# Altium project Karta Radiowa.PrjPcb (part 9 of 9)

## Sheet Flash.SchDoc
size A3
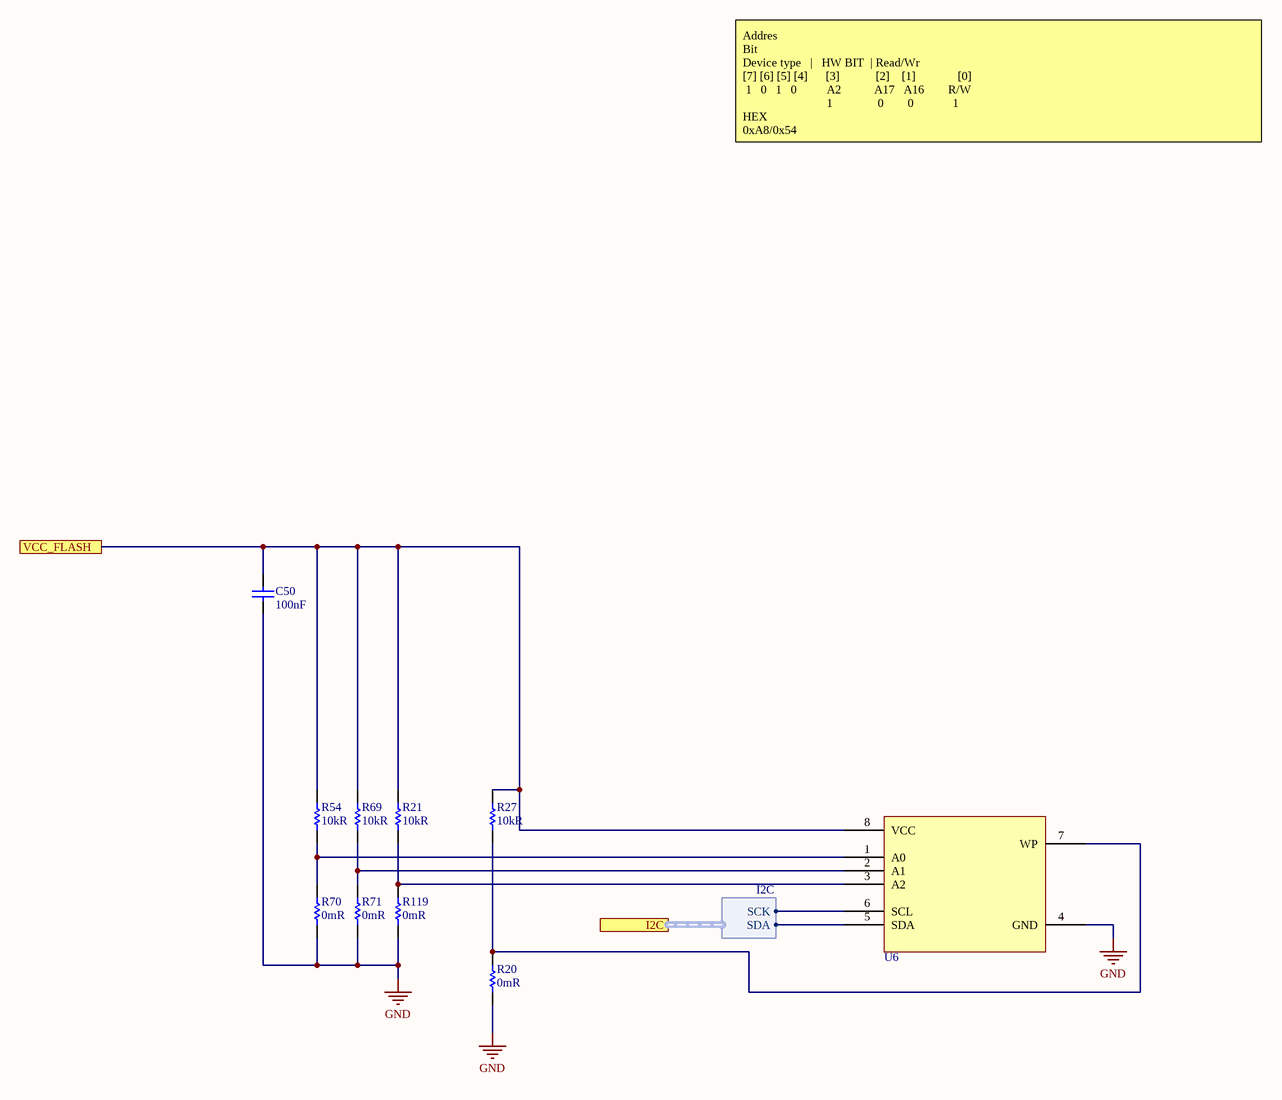
[diagram p14: Flash.SchDoc]

### Parts
C50  100nF  [CAP 0201/0603 KK]
R20  0mR  [RES 0402/1005 RF KK]
R21  10kR  [RES 0402/1005 RF KK]
R27  10kR  [RES 0402/1005 RF KK]
R54  10kR  [RES 0402/1005 RF KK]
R69  10kR  [RES 0402/1005 RF KK]
R70  0mR  [RES 0402/1005 RF KK]
R71  0mR  [RES 0402/1005 RF KK]
R119  0mR  [RES 0402/1005 RF KK]
U6  24LC32AT-I/SN  [8-SOIC 3.9]  (value not drawn)

### Ports
I2C (harness I2C), VCC_FLASH

### Harnesses
I2C: SCK, SDA

### Nets
3V3_MB: C50.2 R21.2 R27.2 R54.2 R69.2 U6.8(VCC) ; port VCC_FLASH
GND: C50.1 R20.1 R70.1 R71.1 R119.1 U6.4(GND)
I2C_SCL: U6.6(SCL) ; port I2C.SCK
I2C_SDA: U6.5(SDA) ; port I2C.SDA
NetR20_2: R20.2 R27.1 U6.7(WP)
NetR21_1: R21.1 R119.2 U6.3(A2)
NetR54_1: R54.1 R70.2 U6.1(A0)
NetR69_1: R69.1 R71.2 U6.2(A1)

### Notes on the sheet
- Addres
  Bit
  Device type   |   HW BIT		| Read/Wr
  [7] [6] [5] [4]      [3]            [2]    [1]              [0]
  1   0   1   0          A2           A17   A16        R/W
  1               0        0             1
  HEX
  0xA8/0x54
- Title
- Size:
- Date:
- A3
- Number:
- Time:
- Revision:
- Sheet
- of
- File:

### Library data of the parts
C50 = Capacitor: Manufacturer 1: Murata; Manufacturer Part Number 1: GRM033R61C104ME84D; Voltage Rating: 16V; Tolerance: 20%; Dielectric: X5R; Supplier 1: Digi-Key; Supplier Part Number 1: 490-9986-1-ND; Stock 1: 503570; Pricing 1: 1=0.10000, 10=0.05400, 100=0.02430, 500=0.01732, 1000=0.01361, 2500=0.01238, 5000=0.01139 (USD); RoHS: Yes; Mount: Surface Mount; Case/Package: 0201; Weight: 1.2E-05oz; Case Code (Metric): 0603; Case Code (Imperial): 0201; Min Operating Temperature: -55°C; Max Operating Temperature: 85°C; Capacitance: 100nF; Packaging: Tape and Reel; Termination: SMD/SMT; Voltage Rating (DC): 16V; Package Quantity: 15000; Length: 0.024inch; Height: 0.3mm; Width: 0.3mm; Thickness: 0.013inch; ComponentLink1URL: http://www.mouser.com/ds/2/281/c02e-2905.pdf?src-supplier=Mouser; ComponentLink1Description: http://www.mouser.com/ds/2/281/c02e-2905.pdf?src-supplier=Mouser; ComponentLink2URL: http://search.murata.co.jp/Ceramy/image/img/A01X/G101/ENG/GRM033R61C104ME84-01.pdf?src-supplier=Digi-Key; ComponentLink2Description: http://search.murata.co.jp/Ceramy/image/img/A01X/G101/ENG/GRM033R61C104ME84-01.pdf?src-supplier=Digi-Key
R20 = Resistor: YAGEO - RC0402JR-070RL. - RES, THICK FILM, 0R, 0.0625W, 0402; Power Rating: 62.5mW; Tolerance: 5%; Voltage Rating: 50V; Max Power Dissipation: 63mW; Temperature Coefficient: 200ppm/°C; Supplier 1: Digi-Key; Supplier Part Number 1: 311-0.0JRCT-ND; Manufacturer: Yageo; Manufacturer Part Number: RC0402JR-070RL; RoHS: Yes; Category: Chip SMD Resistors; Stock 1: 45338179; Pricing 1: 1=0,10000, 10=0,01200, 25=0,00920, 50=0,00680, 100=0,00510, 250=0,00388, 500=0,00310, 1000=0,00228, 5000=0,00163 (USD); Case/Package: 0402; Case Code (Metric): 1005; Case Code (Imperial): 0402; Contact Plating: Tin,Matte; Min Operating Temperature: -55°C; Max Operating Temperature: 155°C; Package Quantity: 1; Resistance: 0mR; Packaging: Tape and Reel; Resistor Type: Thick Film; Number of Terminations: 2; Termination: SMD/SMT; Features: Moisture Resistant; Length: 1mm; Height: 0.016inch; Width: 0.02inch; Depth: 0.5mm; Radiation Hardening: No; REACH SVHC: Unknown; Military Standard: Not; Lead Free: Lead Free; ComponentLink1URL: https://datasheet.ciiva.com/2452/pyu-rc0402-51-rohs-l-6-2452608.pdf?src-supplier=Digi-Key; ComponentLink1Description: https://datasheet.ciiva.com/2452/pyu-rc0402-51-rohs-l-6-2452608.pdf?src-supplier=Digi-Key; ComponentLink2URL: https://datasheet.ciiva.com/11808/0900766b80c66297-11808195.pdf?src-supplier=RSComponents; ComponentLink2Description: https://datasheet.ciiva.com/11808/0900766b80c66297-11808195.pdf?src-supplier=RSComponents; ComponentLink3URL: https://datasheet.ciiva.com/2452/pyu-r-int-thick-7-2452609.pdf?src-supplier=Digi-Key; ComponentLink3Description: https://datasheet.ciiva.com/2452/pyu-r-int-thick-7-2452609.pdf?src-supplier=Digi-Key; ComponentLink4URL: https://datasheet.ciiva.com/2452/pyu-r-int-thick-7-2452610.pdf?src-supplier=Digi-Key; ComponentLink4Description: https://datasheet.ciiva.com/2452/pyu-r-int-thick-7-2452610.pdf?src-supplier=Digi-Key; ComponentLink5URL: https://datasheet.ciiva.com/8896/pyu-rc0402-51-rohs-l-6-8896201.pdf?src-supplier=Avnet; ComponentLink5Description: https://datasheet.ciiva.com/8896/pyu-rc0402-51-rohs-l-6-8896201.pdf?src-supplier=Avnet; ComponentLink6URL: https://datasheet.ciiva.com/28386/pyu-rc0402-51-rohs-l-6-28386633.pdf?src-supplier=Avnet+Europe; ComponentLink6Description: https://datasheet.ciiva.com/28386/pyu-rc0402-51-rohs-l-6-28386633.pdf?src-supplier=Avnet+Europe; ComponentLink7URL: https://datasheet.ciiva.com/22747/1018594-22747515.pdf?src-supplier=Element14; ComponentLink7Description: https://datasheet.ciiva.com/22747/1018594-22747515.pdf?src-supplier=Element14; ComponentLink8URL: https://datasheet.ciiva.com/15189/getdatasheetpartid-326379-15189533.pdf?src-supplier=Verical; ComponentLink8Description: https://datasheet.ciiva.com/15189/getdatasheetpartid-326379-15189533.pdf?src-supplier=Verical
R21 R27 R54 R69 = Resistor: Manufacturer 1: Vishay; Manufacturer Part Number 1: CRCW0402-10K0FKED; Tolerance: 1%; Power Rating: 63mW; Voltage Rating: 50V; Temperature Coefficient: 100ppm/°C; Supplier 1: Newark; Supplier Part Number 1: 52K6595; Stock 1: 0; RoHS: Yes; Mount: Surface Mount; Case/Package: 0402; Number of Pins: 2; Weight: 2.3E-05oz; Case Code (Metric): 1005; Case Code (Imperial): 0402; Contact Plating: Tin; Min Operating Temperature: -55°C; Max Operating Temperature: 155°C; Resistance: 10kR; Package Quantity: 10; Packaging: Tape and Reel; Termination: SMD/SMT; Military Standard: Not; Composition: Thick Film; Voltage Rating (DC): 50V; Number of Terminations: 2; Max Power Dissipation: 63mW; Features: Automotive AEC-Q200; Length: 1mm; Height: 0.35mm; Depth: 0.5mm; Width: 0.02inch; Radiation Hardening: No; REACH SVHC: Unknown; Lead Free: Lead Free; ComponentLink1URL: https://datasheet.ciiva.com/11809/0900766b80d98824-11809984.pdf?src-supplier=RSComponents; ComponentLink1Description: https://datasheet.ciiva.com/11809/0900766b80d98824-11809984.pdf?src-supplier=RSComponents; ComponentLink2URL: https://datasheet.ciiva.com/2463/dcrcwe3-2463025.pdf?src-supplier=Digi-Key; ComponentLink2Description: https://datasheet.ciiva.com/2463/dcrcwe3-2463025.pdf?src-supplier=Digi-Key; ComponentLink3URL: https://datasheet.ciiva.com/2463/dcrcwe3-2463026.pdf?src-supplier=Digi-Key; ComponentLink3Description: https://datasheet.ciiva.com/2463/dcrcwe3-2463026.pdf?src-supplier=Digi-Key; ComponentLink4URL: https://datasheet.ciiva.com/2463/dcrcwe3-2463027.pdf?src-supplier=Digi-Key; ComponentLink4Description: https://datasheet.ciiva.com/2463/dcrcwe3-2463027.pdf?src-supplier=Digi-Key; ComponentLink5URL: https://datasheet.ciiva.com/46385/1697337-46385560.pdf?src-supplier=Element14; ComponentLink5Description: https://datasheet.ciiva.com/46385/1697337-46385560.pdf?src-supplier=Element14; ComponentLink6URL: https://datasheet.ciiva.com/3255/dcrcwe3-3255961.pdf?src-supplier=Avnet; ComponentLink6Description: https://datasheet.ciiva.com/3255/dcrcwe3-3255961.pdf?src-supplier=Avnet; ComponentLink7URL: https://datasheet.ciiva.com/3255/dcrcwe3-3255962.pdf?src-supplier=Avnet; ComponentLink7Description: https://datasheet.ciiva.com/3255/dcrcwe3-3255962.pdf?src-supplier=Avnet; ComponentLink8URL: https://datasheet.ciiva.com/5547/dcrcwe3-109170-5547786.pdf?src-supplier=Mouser; ComponentLink8Description: https://datasheet.ciiva.com/5547/dcrcwe3-109170-5547786.pdf?src-supplier=Mouser; ComponentLink9URL: https://datasheet.ciiva.com/26316/fld-crcw-e3-data-en-26316618.pdf?src-supplier=Distrelec; ComponentLink9Description: https://datasheet.ciiva.com/26316/fld-crcw-e3-data-en-26316618.pdf?src-supplier=Distrelec; ComponentLink10URL: https://datasheet.ciiva.com/16208/dcrcwe3-16208525.pdf?src-supplier=Future+Electronics; ComponentLink10Description: https://datasheet.ciiva.com/16208/dcrcwe3-16208525.pdf?src-supplier=Future+Electronics; ComponentLink11URL: https://datasheet.ciiva.com/36856/1720486-36856909.pdf?src-supplier=Element14; ComponentLink11Description: https://datasheet.ciiva.com/36856/1720486-36856909.pdf?src-supplier=Element14
R70 R71 R119 = Resistor: Manufacturer 1: Yageo; Manufacturer Part Number 1: RC0402JR-070RL; Power Rating: 62.5mW; Tolerance: 5%; Voltage Rating: 50V; Max Power Dissipation: 63mW; Temperature Coefficient: 200ppm/°C; Supplier 1: Digi-Key; Supplier Part Number 1: 311-0.0JRCT-ND; Stock 1: 69822252; Pricing 1: 1=0.10000, 10=0.01200, 25=0.00920, 50=0.00680, 100=0.00510, 250=0.00388, 500=0.00308, 1000=0.00227, 5000=0.00163 (USD); RoHS: Yes; Case/Package: 0402; Contact Plating: Tin,Matte; Case Code (Metric): 1005; Case Code (Imperial): 0402; Min Operating Temperature: -55°C; Max Operating Temperature: 155°C; Resistance: 0mR; Packaging: Tape and Reel; Composition: Thick Film; Package Quantity: 1; Number of Terminations: 2; Termination: SMD/SMT; Military Standard: Not; Features: Moisture Resistant; Length: 1mm; Height: 0.016inch; Width: 0.02inch; Depth: 0.5mm; Radiation Hardening: No; REACH SVHC: Unknown; Lead Free: Lead Free; ComponentLink1URL: https://datasheet.ciiva.com/2452/pyu-rc0402-51-rohs-l-6-2452608.pdf?src-supplier=Digi-Key; ComponentLink1Description: https://datasheet.ciiva.com/2452/pyu-rc0402-51-rohs-l-6-2452608.pdf?src-supplier=Digi-Key; ComponentLink2URL: https://datasheet.ciiva.com/11808/0900766b80c66297-11808195.pdf?src-supplier=RSComponents; ComponentLink2Description: https://datasheet.ciiva.com/11808/0900766b80c66297-11808195.pdf?src-supplier=RSComponents; ComponentLink3URL: https://datasheet.ciiva.com/2452/pyu-r-int-thick-7-2452609.pdf?src-supplier=Digi-Key; ComponentLink3Description: https://datasheet.ciiva.com/2452/pyu-r-int-thick-7-2452609.pdf?src-supplier=Digi-Key; ComponentLink4URL: https://datasheet.ciiva.com/22747/1018594-22747515.pdf?src-supplier=Element14; ComponentLink4Description: https://datasheet.ciiva.com/22747/1018594-22747515.pdf?src-supplier=Element14; ComponentLink5URL: https://datasheet.ciiva.com/7983/1018594-7983535.pdf?src-supplier=Element14; ComponentLink5Description: https://datasheet.ciiva.com/7983/1018594-7983535.pdf?src-supplier=Element14; ComponentLink6URL: https://datasheet.ciiva.com/2452/pyu-r-int-thick-7-2452610.pdf?src-supplier=Digi-Key; ComponentLink6Description: https://datasheet.ciiva.com/2452/pyu-r-int-thick-7-2452610.pdf?src-supplier=Digi-Key; ComponentLink7URL: https://datasheet.ciiva.com/8896/pyu-rc0402-51-rohs-l-6-8896201.pdf?src-supplier=Avnet; ComponentLink7Description: https://datasheet.ciiva.com/8896/pyu-rc0402-51-rohs-l-6-8896201.pdf?src-supplier=Avnet; ComponentLink8URL: https://datasheet.ciiva.com/28386/pyu-rc0402-51-rohs-l-6-28386633.pdf?src-supplier=Avnet+Europe; ComponentLink8Description: https://datasheet.ciiva.com/28386/pyu-rc0402-51-rohs-l-6-28386633.pdf?src-supplier=Avnet+Europe; ComponentLink9URL: https://datasheet.ciiva.com/15189/getdatasheetpartid-326379-15189533.pdf?src-supplier=Verical; ComponentLink9Description: https://datasheet.ciiva.com/15189/getdatasheetpartid-326379-15189533.pdf?src-supplier=Verical
U6 = 24LC32AT-I/SN: Microchip 24LC32AT-I/SN Serial EEPROM Memory, 32kbit, 1000ns, 2.5  5.5 V 8-Pin SOIC; Interface: I2C,Serial,2-Wire; Access Time: 900ns; Frequency: 400kHz; Max Supply Voltage: 5.5V; Min Supply Voltage: 2.5V; Nominal Supply Current: 3mA; Density: 32Kb; Number of Words: 4; Supplier 1: Digi-Key; Manufacturer: Microchip; Manufacturer Part Number: 24LC32AT-I/SN; RoHS: Yes; Category: EEPROM; Stock 1: 9460; Pricing 1: 1=0,34000, 25=0,33000, 100=0,31000 (USD); Mount: Surface Mount; Case/Package: SOIC; Number of Pins: 8; Contact Plating: Tin,Matte; Min Operating Temperature: -40°C; Max Operating Temperature: 85°C; Packaging: Tape and Reel; Package Quantity: 3300; Memory Type: EEPROM; Memory Size: 32Kb; Max Frequency: 400kHz; Length: 4.9mm; Height: 1.5mm; Width: 3.9mm; Radiation Hardening: No; REACH SVHC: No SVHC; Lead Free: Lead Free; ComponentLink1URL: https://datasheet.ciiva.com/1165/1669362-1165104.pdf?src-supplier=Newark; ComponentLink1Description: https://datasheet.ciiva.com/1165/1669362-1165104.pdf?src-supplier=Newark; ComponentLink2URL: https://datasheet.ciiva.com/15123/getdatasheetpartid-768552-15123863.pdf?src-supplier=Verical; ComponentLink2Description: https://datasheet.ciiva.com/15123/getdatasheetpartid-768552-15123863.pdf?src-supplier=Verical; ComponentLink3URL: https://datasheet.ciiva.com/14134/24aa32a-24lc32a-eng-tds-14134838.pdf?src-supplier=Distrelec; ComponentLink3Description: https://datasheet.ciiva.com/14134/24aa32a-24lc32a-eng-tds-14134838.pdf?src-supplier=Distrelec; ComponentLink4URL: https://datasheet.ciiva.com/8059/1669362-8059144.pdf?src-supplier=Element14; ComponentLink4Description: https://datasheet.ciiva.com/8059/1669362-8059144.pdf?src-supplier=Element14; ComponentLink5URL: https://datasheet.ciiva.com/3184/21713l-3184953.pdf?src-supplier=Avnet; ComponentLink5Description: https://datasheet.ciiva.com/3184/21713l-3184953.pdf?src-supplier=Avnet; ComponentLink6URL: https://datasheet.ciiva.com/17651/21713l-17651374.pdf?src-supplier=Avnet+Europe; ComponentLink6Description: https://datasheet.ciiva.com/17651/21713l-17651374.pdf?src-supplier=Avnet+Europe; Supplier Part Number 1: 24LC32AT-I/SNCT-ND

## Sheet Connector miniPCIe.SchDoc
size A3
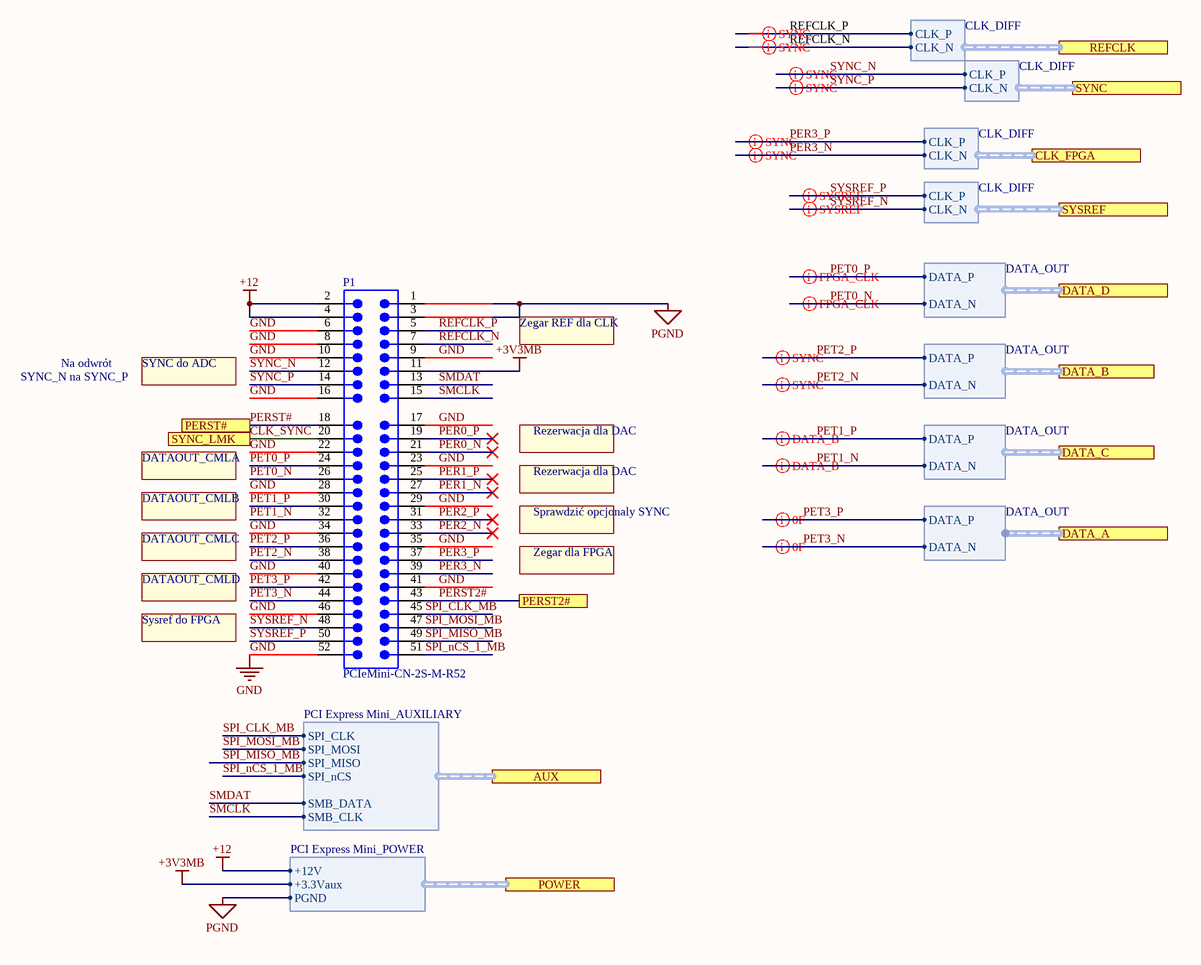
[diagram p15: Connector miniPCIe.SchDoc]

### Parts
P1  PCIeMini-CN-2S-M-R52  [PCIeMini-GF-2D-800-1K-S52]  (no BOM)

### Ports
AUX (harness PCI Express Mini_AUXILIARY), CLK_FPGA (harness CLK_DIFF), DATA_A (harness DATA_OUT), DATA_B (harness DATA_OUT), DATA_C (harness DATA_OUT), DATA_D (harness DATA_OUT), PERST2#, PERST#, POWER (harness PCI Express Mini_POWER), REFCLK (harness CLK_DIFF), SYNC (harness CLK_DIFF), SYNC_LMK, SYSREF (harness CLK_DIFF)

### Harnesses
PCI Express Mini_POWER: +3.3Vaux, PGND, +12V
PCI Express Mini_AUXILIARY: SMB_DATA, SMB_CLK, SPI_nCS, SPI_MISO, SPI_MOSI, SPI_CLK
DATA_OUT: DATA_P, DATA_N
CLK_DIFF: CLK_P, CLK_N

### Nets
+3V3MB: P1.11 ; port POWER.+3.3Vaux  [project net 3V3_MB]
+12: P1.2 P1.4 ; port POWER.+12V
GND: P1.6 P1.8 P1.9 P1.10 P1.16 P1.17 P1.22 P1.23 P1.28 P1.29 P1.34 P1.35 P1.40 P1.41 P1.46 P1.52
PGND: P1.1 P1.3 ; port POWER.PGND
CLK_SYNC: P1.20 ; port SYNC_LMK  [project net 04610_SYNC_3V3]
PER0_N: P1.21
PER0_P: P1.19
PER1_N: P1.27
PER1_P: P1.25
PER2_N: P1.33
PER2_P: P1.31
PER3_N: P1.39 ; port CLK_FPGA.CLK_N  [project net O3_N]
PER3_P: P1.37 ; port CLK_FPGA.CLK_P  [project net O3_P]
PERST2#: P1.43 ; port PERST2#
PERST#: P1.18 ; port PERST#
PET0_N: P1.26 ; port DATA_D.DATA_N  [project net CMLout4_N]
PET0_P: P1.24 ; port DATA_D.DATA_P  [project net CMLout4_P]
PET1_N: P1.32 ; port DATA_C.DATA_N  [project net CMLout3_N]
PET1_P: P1.30 ; port DATA_C.DATA_P  [project net CMLout3_P]
PET2_N: P1.38 ; port DATA_B.DATA_N  [project net CMLout2_N]
PET2_P: P1.36 ; port DATA_B.DATA_P  [project net CMLout2_P]
PET3_N: P1.44 ; port DATA_A.DATA_N  [project net CMLout1_N]
PET3_P: P1.42 ; port DATA_A.DATA_P  [project net CMLout1_P]
REFCLK_N: P1.7 ; port REFCLK.CLK_N  [project net CLKin1_N]
REFCLK_P: P1.5 ; port REFCLK.CLK_P  [project net CLKin1_P]
SMCLK: P1.15 ; port AUX.SMB_CLK
SMDAT: P1.13 ; port AUX.SMB_DATA
SPI_CLK_MB: P1.45 ; port AUX.SPI_CLK
SPI_MISO_MB: P1.49 ; port AUX.SPI_MISO
SPI_MOSI_MB: P1.47 ; port AUX.SPI_MOSI
SPI_nCS_1_MB: P1.51 ; port AUX.SPI_nCS
SYNC_N: P1.12 ; port SYNC.CLK_P
SYNC_P: P1.14 ; port SYNC.CLK_N
SYSREF_N: P1.48 ; port SYSREF.CLK_N  [project net O1_N]
SYSREF_P: P1.50 ; port SYSREF.CLK_P  [project net O1_P]

### Layout directives
differential pair; differential pair class DIFF_100: CLKin1_N, CLKin1_P, CMLout1_N, CMLout1_P, CMLout2_N, CMLout2_P, CMLout3_N, CMLout3_P, CMLout4_N, CMLout4_P, O1_N, O1_P, O3_N, O3_P, SYNC_N, SYNC_P

### Notes on the sheet
- SYNC_N na SYNC_P
- Na odwrót
- SYNC do ADC
- Zegar REF dla CLK
- Rezerwacja dla DAC
- DATAOUT_CMLA
- DATAOUT_CMLB
- Sprawdzić opcjonaly SYNC
- DATAOUT_CMLC
- DATAOUT_CMLD
- Zegar dla FPGA
- Sysref do FPGA
- Title
- Size:
- Date:
- A3
- Number:
- Time:
- Revision:
- Sheet
- of
- File:

### Library data of the parts
P1 = CMP-0001-00067-2: Golden finger, PCIeMini, Dual, Staggered, Pitch 0.8mm, 52-Position; Mating Connector: Tyco-292443-1; Package Version: rev1.2, Oct-2007; Publisher: Altium; Package Reference: PCIeMini-GF-2D-800-1K-S52; ClassName: Edge Connector; Datasheet Version: Revision 1.2 Oct-2007

## Nets that join several sheets
3V3_MB: Komunikacja (17 pins), Current_and_voltage (C44.2 R111.1 R112.1 U3.6), Flash (6 pins), Connector miniPCIe (P1.11)
+12: Current_and_voltage (R15.1 U3.10), Connector miniPCIe (P1.2 P1.4)
GND: Komunikacja (36 pins), Tor antenowy (C37.1 C70.1), Zasilanie (43 pins), LED_IND (D4.2 D6.2 D8.2 D9.2), Zasilanie_ADC (20 pins), Zegar (12 pins), Zasilanie_LMK (52 pins), Flash (6 pins), Connector miniPCIe (16 pins)
PGND: Zasilanie (24 pins), LED_IND (D7.2), Current_and_voltage (C44.1 R129.2 R130.2 U3.7), Connector miniPCIe (P1.1 P1.3)
RFGND: Karta_Radiowa (8 pins), ADC (5 pins), Tor (U11.2 U11.5), TorGnss (14 pins), ATT (15 pins), Tor antenowy (32 pins), Zasilanie (23 pins), LED_IND (D3.2), Zasilanie_ADC (28 pins)
1V8@0A5_COM: Komunikacja (16 pins), Zasilanie (C127.2 R128.2 U24.1 U24.2), Zasilanie_ADC (C136.2 C137.2 U1.13 U1.38), Zasilanie_LMK (C158.2 C159.2 FB17.1)
1V8@1A: Zasilanie (5 pins), Zasilanie_LMK (21 pins)
1V25@0A5: Zasilanie (C76.2 FB32.2), Zasilanie_ADC (17 pins)
1V25@1A: Zasilanie (C72.2 FB31.2), Zasilanie_ADC (18 pins)
2V5@1A: Zasilanie (C68.2 FB7.2), Zasilanie_ADC (26 pins)
3V3@0A5: Tor antenowy (8 pins), Zasilanie (C78.2 FB4.2), LED_IND (R77.2), Zasilanie_ADC (8 pins)
3V3@0A5_COM: Komunikacja (22 pins), Zasilanie (9 pins), LED_IND (R132.2), Current_and_voltage (R83.2)
3V3@1A_1: Zasilanie (5 pins), LED_IND (R78.2), Zasilanie_LMK (15 pins)
3V6_DCDC: Zasilanie (37 pins), LED_IND (R133.2)
5V: Tor (FB2.1 FB3.1), Zasilanie (C61.2 U20.5)
6V_DCDC: Tor antenowy (C37.2 C70.2 U5.1), Zasilanie (8 pins), LED_IND (R76.2)
12V: Zasilanie (12 pins), LED_IND (R80.2), Current_and_voltage (R15.2 U3.8 U3.9)
04610_SYNC_3V3: Komunikacja (U32.2), Connector miniPCIe (P1.20)
9690_FAST_DETECT: ADC (U1.17), Komunikacja (U13.3)
9690_PDWN: Komunikacja (U32.9), Zasilanie_ADC (U1.14)
ADC_CLK9690_N: ADC (U1.54), Zegar (C187.2 R14.1)
ADC_CLK9690_P: ADC (U1.53), Zegar (C186.2 R14.2)
adc_Sysref_N: ADC (U1.59), Zegar (C185.2 R101.1)
adc_Sysref_P: ADC (U1.58), Zegar (C183.2 R101.2)
Alert: Komunikacja (U33.19), Current_and_voltage (R83.1 U3.3)
AN_IN_N: ADC (C3.1 R7.2), Tor (U11.4)
AN_IN_P: ADC (C6.1 R7.1), Tor (U11.3)
ATT_V1: Komunikacja (U4.19), ATT (R39.2)
ATT_V2: Komunikacja (U4.20), ATT (U2.20)
ATT_V3: Komunikacja (U4.21), ATT (U2.21)
ATT_V4: Komunikacja (U4.22), ATT (U2.22)
ATT_V5: Komunikacja (U4.23), ATT (U2.23)
ATT_V6: Komunikacja (U4.24), ATT (U2.24)
CLKin1_N: Zegar (R94.1), Connector miniPCIe (P1.7)
CLKin1_P: Zegar (R96.1), Connector miniPCIe (P1.5)
CMLout1_N: ADC (C15.2 R98.2), Connector miniPCIe (P1.44)
CMLout1_P: ADC (C16.2 R98.1), Connector miniPCIe (P1.42)
CMLout2_N: ADC (C17.2 R104.2), Connector miniPCIe (P1.38)
CMLout2_P: ADC (C18.2 R104.1), Connector miniPCIe (P1.36)
CMLout3_N: ADC (C35.2 R105.2), Connector miniPCIe (P1.32)
CMLout3_P: ADC (C36.2 R105.1), Connector miniPCIe (P1.30)
CMLout4_N: ADC (C38.2 R113.2), Connector miniPCIe (P1.26)
CMLout4_P: ADC (C39.2 R113.1), Connector miniPCIe (P1.24)
EN_1V8_LDO1: Komunikacja (U33.21), Zasilanie (U18.6)
EN_1V25_LDO0: Komunikacja (U33.26), Zasilanie (U7.20)
EN_1V25_LDO2: Komunikacja (U33.27), Zasilanie (U19.5)
EN_2V5_LDO0: Komunikacja (U33.20), Zasilanie (U7.6)
EN_3V3_LDO1: Komunikacja (U33.28), Zasilanie (U18.20)
EN_3V3_LDO3: Komunikacja (U33.1), Zasilanie (U21.5)
EN_5V: Komunikacja (U33.18), Zasilanie (U20.3)
EN_ANT_SUPP: Komunikacja (U33.17), Tor antenowy (R32.1)
EN_RF_P: Komunikacja (U4.17), Tor antenowy (U15.14)
GND_VCXO: Zegar (C177.1 X1.3), Zasilanie_LMK (C209.1 C210.1 FB29.1)
I2C_SCL: Komunikacja (R17.2 R51.2 U16.3), Current_and_voltage (U3.5), Flash (U6.6)
I2C_SDA: Komunikacja (R16.1 R50.2 U16.4), Current_and_voltage (U3.4), Flash (U6.5)
LMK_CLKsel: Komunikacja (U32.12), Zegar (U9.34)
NetC22_2: ATT (U2.4), Tor antenowy (C22.2 C253.2)
NetC25_1: TorGnss (C25.1), ATT (U2.15)
O1_N: Zegar (C189.2), Connector miniPCIe (P1.48)
O1_P: Zegar (C188.2), Connector miniPCIe (P1.50)
O3_N: Zegar (C227.2), Connector miniPCIe (P1.39)
O3_P: Zegar (C228.2), Connector miniPCIe (P1.37)
PERST2#: Komunikacja (U33.16), Connector miniPCIe (P1.43)
PERST#: Komunikacja (R72.2 R110.2 U4.14 U33.14), Connector miniPCIe (P1.18)
PG_1V8_1: Komunikacja (U33.25), Zasilanie (R52.2 U18.17)
PG_1V25_0: Komunikacja (U33.22), Zasilanie (R37.2 U7.17)
PG_2V5_0: Komunikacja (U33.23), Zasilanie (R38.2 U7.9)
PG_3V3_1: Komunikacja (U33.24), Zasilanie (R42.2 U18.9)
Q: Komunikacja (U33.4), Tor antenowy (R85.3 U15.13)
~{Q}: ATT (R39.1 U2.19), Tor antenowy (R82.3 U15.12)
RST: Komunikacja (U4.18), Tor antenowy (U15.15)
SMCLK: Komunikacja (R51.1), Connector miniPCIe (P1.15)
SMDAT: Komunikacja (R50.1), Connector miniPCIe (P1.13)
SPI_CLK_AD: ADC (U1.36), Komunikacja (U10.12)
SPI_CLK_MB: Komunikacja (U8.1 U10.1), Connector miniPCIe (P1.45)
SPI_CS_AD: ADC (U1.37), Komunikacja (R36.2 U10.9)
SPI_MISO_MB: Komunikacja (U8.3 U10.3), Connector miniPCIe (P1.49)
SPI_MOSI_AD: ADC (U1.35), Komunikacja (R29.1 U10.10)
SPI_MOSI_MB: Komunikacja (U8.2 U10.2), Connector miniPCIe (P1.47)
SPI_nCS_1_MB: Komunikacja (R48.1 U8.4 U10.4), Connector miniPCIe (P1.51)
SYNC_N: ADC (R99.1 U1.21), Connector miniPCIe (P1.12)
SYNC_P: ADC (R99.2 U1.20), Connector miniPCIe (P1.14)
Tor_RF_50: Tor (U11.1), TorGnss (C32.2)
VC_SUPP: Zegar (X1.6), Zasilanie_LMK (C209.2 C210.2 FB26.2)
VCC_5_ATT: Tor (FB2.2), ATT (C9.2 C10.1 U2.2)
VCC_AMP_5: Tor (FB3.2), TorGnss (C33.2 R46.2)

## Assembly variants
V1: not fitted C175 C176 C177 C178 C179 C207 C208 C209 C210 C222 C252 C253 C254 C255 C256 C257 C258 C259 FB26 FB29 FB? L? R14 R16 R17 R20 R22 R25 R26 R35 R37 R38 R41 R45 R47 R48 R54 R69 R79 R82 R84 R85 R89 R90 R91 R97 R98 R101 R101 R104 R105 R109 R111 R111 R112 R112 R113 R113 R114 R115 R115 R116 R119 R119 R120 R124 R125 R127 R128 R135 R138 R139 R140 R? R? R? R? X1